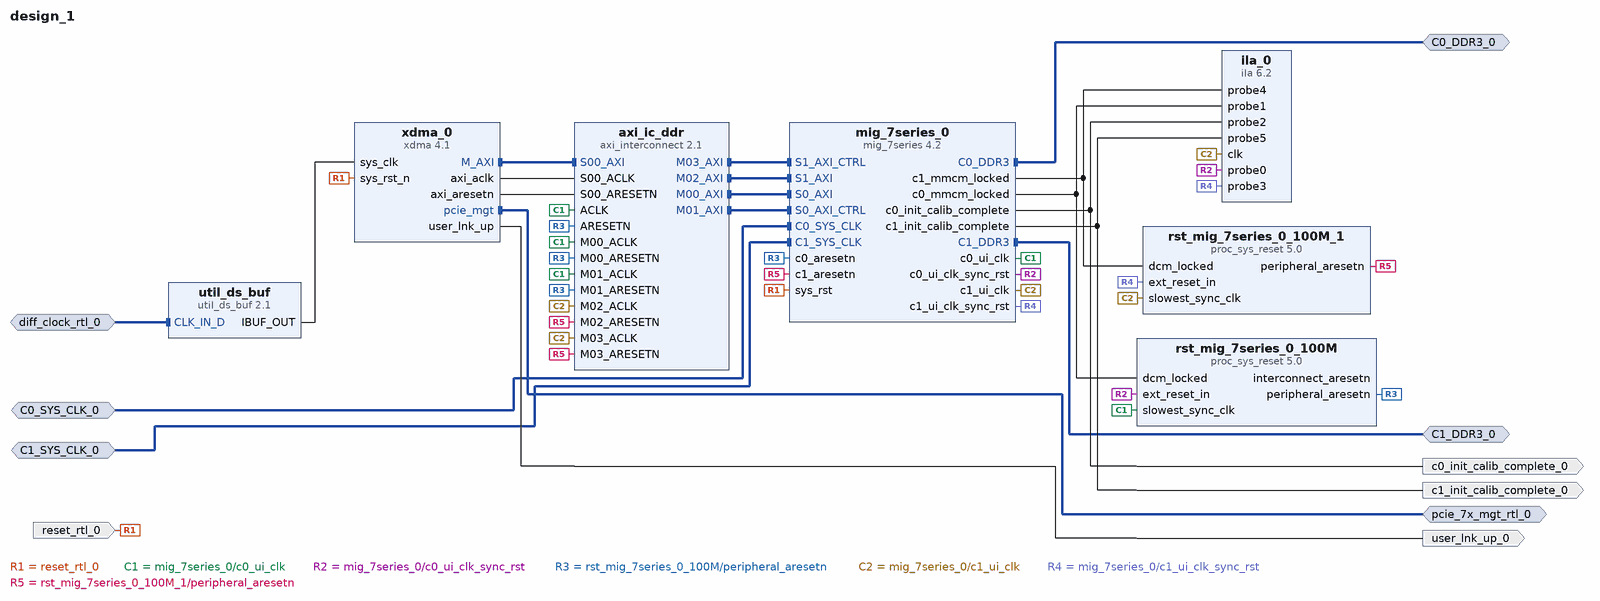
[diagram p0: block diagram of the top level]
# Vivado block design design_1, xc7k480tffg1156-2, Vivado 2020.2
create_bd_design design_1

create_bd_intf_port -mode Master -vlnv xilinx.com:interface:pcie_7x_mgt_rtl:1.0 pcie_7x_mgt_rtl_0
create_bd_intf_port -mode Slave -vlnv xilinx.com:interface:diff_clock_rtl:1.0 diff_clock_rtl_0
set_property -dict {CONFIG.FREQ_HZ 100000000} [get_bd_intf_ports diff_clock_rtl_0]
create_bd_intf_port -mode Master -vlnv xilinx.com:interface:ddrx_rtl:1.0 C0_DDR3_0
create_bd_intf_port -mode Slave -vlnv xilinx.com:interface:diff_clock_rtl:1.0 C0_SYS_CLK_0
create_bd_intf_port -mode Master -vlnv xilinx.com:interface:ddrx_rtl:1.0 C1_DDR3_0
create_bd_intf_port -mode Slave -vlnv xilinx.com:interface:diff_clock_rtl:1.0 C1_SYS_CLK_0
create_bd_port -dir I -type rst reset_rtl_0
set_property -dict {CONFIG.POLARITY ACTIVE_LOW} [get_bd_ports reset_rtl_0]
create_bd_port -dir O user_lnk_up_0
create_bd_port -dir O c0_init_calib_complete_0
create_bd_port -dir O c1_init_calib_complete_0

create_bd_cell -type ip -vlnv xilinx.com:ip:util_ds_buf:2.1 util_ds_buf
set_property -dict {CONFIG.C_BUF_TYPE IBUFDSGTE} [get_bd_cells util_ds_buf]
create_bd_cell -type ip -vlnv xilinx.com:ip:xdma:4.1 xdma_0
set_property -dict [list \
  CONFIG.PF0_DEVICE_ID_mqdma 9014 \
  CONFIG.PF2_DEVICE_ID_mqdma 9014 \
  CONFIG.PF3_DEVICE_ID_mqdma 9014 \
  CONFIG.axi_data_width 64_bit \
  CONFIG.axisten_freq 125 \
  CONFIG.mode_selection Basic \
  CONFIG.pf0_device_id 7014 \
  CONFIG.pl_link_cap_max_link_speed 2.5_GT/s \
  CONFIG.pl_link_cap_max_link_width X4 \
  CONFIG.xdma_axi_intf_mm AXI_Memory_Mapped \
  CONFIG.xdma_pcie_64bit_en false \
  CONFIG.xdma_rnum_chnl 2 \
  CONFIG.xdma_wnum_chnl 2 \
] [get_bd_cells xdma_0]
create_bd_cell -type ip -vlnv xilinx.com:ip:mig_7series:4.2 mig_7series_0
set_property -dict [list \
  CONFIG.BOARD_MIG_PARAM Custom \
  CONFIG.MIG_DONT_TOUCH_PARAM Custom \
  CONFIG.RESET_BOARD_INTERFACE Custom \
  CONFIG.XML_INPUT_FILE mig_a.prj \
] [get_bd_cells mig_7series_0]
create_bd_cell -type ip -vlnv xilinx.com:ip:axi_interconnect:2.1 axi_ic_ddr
set_property -dict {CONFIG.NUM_MI 4 CONFIG.NUM_SI 1} [get_bd_cells axi_ic_ddr]
create_bd_cell -type ip -vlnv xilinx.com:ip:proc_sys_reset:5.0 rst_mig_7series_0_100M
create_bd_cell -type ip -vlnv xilinx.com:ip:proc_sys_reset:5.0 rst_mig_7series_0_100M_1
create_bd_cell -type ip -vlnv xilinx.com:ip:ila:6.2 ila_0
set_property -dict [list \
  CONFIG.C_DATA_DEPTH 2048 \
  CONFIG.C_ENABLE_ILA_AXI_MON false \
  CONFIG.C_MONITOR_TYPE Native \
  CONFIG.C_NUM_OF_PROBES 6 \
] [get_bd_cells ila_0]

# ---- connections ----

connect_bd_intf_net -intf_net diff_clock_rtl_0_1 [get_bd_intf_ports diff_clock_rtl_0] [get_bd_intf_pins util_ds_buf/CLK_IN_D]
connect_bd_intf_net [get_bd_intf_pins axi_ic_ddr/M03_AXI] [get_bd_intf_pins mig_7series_0/S1_AXI_CTRL]
connect_bd_intf_net [get_bd_intf_pins axi_ic_ddr/M02_AXI] [get_bd_intf_pins mig_7series_0/S1_AXI]
connect_bd_intf_net [get_bd_intf_pins mig_7series_0/S0_AXI] [get_bd_intf_pins axi_ic_ddr/M00_AXI]
connect_bd_intf_net [get_bd_intf_pins xdma_0/M_AXI] [get_bd_intf_pins axi_ic_ddr/S00_AXI]
connect_bd_intf_net [get_bd_intf_ports C1_DDR3_0] [get_bd_intf_pins mig_7series_0/C1_DDR3]
connect_bd_intf_net -intf_net C0_SYS_CLK_0_1 [get_bd_intf_ports C0_SYS_CLK_0] [get_bd_intf_pins mig_7series_0/C0_SYS_CLK]
connect_bd_intf_net [get_bd_intf_ports pcie_7x_mgt_rtl_0] [get_bd_intf_pins xdma_0/pcie_mgt]
connect_bd_intf_net [get_bd_intf_pins axi_ic_ddr/M01_AXI] [get_bd_intf_pins mig_7series_0/S0_AXI_CTRL]
connect_bd_intf_net [get_bd_intf_ports C0_DDR3_0] [get_bd_intf_pins mig_7series_0/C0_DDR3]
connect_bd_intf_net -intf_net C1_SYS_CLK_0_1 [get_bd_intf_ports C1_SYS_CLK_0] [get_bd_intf_pins mig_7series_0/C1_SYS_CLK]
connect_bd_net -net reset_rtl_0_1 [get_bd_ports reset_rtl_0] [get_bd_pins xdma_0/sys_rst_n] [get_bd_pins mig_7series_0/sys_rst]
connect_bd_net [get_bd_pins util_ds_buf/IBUF_OUT] [get_bd_pins xdma_0/sys_clk]
connect_bd_net [get_bd_pins xdma_0/user_lnk_up] [get_bd_ports user_lnk_up_0]
connect_bd_net [get_bd_pins mig_7series_0/c0_ui_clk] \
  [get_bd_pins axi_ic_ddr/ACLK] [get_bd_pins rst_mig_7series_0_100M/slowest_sync_clk] [get_bd_pins axi_ic_ddr/M00_ACLK] \
  [get_bd_pins axi_ic_ddr/M01_ACLK]
connect_bd_net [get_bd_pins mig_7series_0/c0_mmcm_locked] [get_bd_pins rst_mig_7series_0_100M/dcm_locked] [get_bd_pins ila_0/probe1]
connect_bd_net [get_bd_pins mig_7series_0/c0_ui_clk_sync_rst] [get_bd_pins rst_mig_7series_0_100M/ext_reset_in] [get_bd_pins ila_0/probe0]
connect_bd_net [get_bd_pins rst_mig_7series_0_100M/peripheral_aresetn] \
  [get_bd_pins axi_ic_ddr/ARESETN] [get_bd_pins axi_ic_ddr/M00_ARESETN] [get_bd_pins mig_7series_0/c0_aresetn] \
  [get_bd_pins axi_ic_ddr/M01_ARESETN]
connect_bd_net [get_bd_pins xdma_0/axi_aclk] [get_bd_pins axi_ic_ddr/S00_ACLK]
connect_bd_net [get_bd_pins xdma_0/axi_aresetn] [get_bd_pins axi_ic_ddr/S00_ARESETN]
connect_bd_net [get_bd_pins mig_7series_0/c1_ui_clk] \
  [get_bd_pins axi_ic_ddr/M02_ACLK] [get_bd_pins rst_mig_7series_0_100M_1/slowest_sync_clk] [get_bd_pins axi_ic_ddr/M03_ACLK] \
  [get_bd_pins ila_0/clk]
connect_bd_net [get_bd_pins mig_7series_0/c1_mmcm_locked] [get_bd_pins rst_mig_7series_0_100M_1/dcm_locked] [get_bd_pins ila_0/probe4]
connect_bd_net [get_bd_pins mig_7series_0/c1_ui_clk_sync_rst] [get_bd_pins rst_mig_7series_0_100M_1/ext_reset_in] [get_bd_pins ila_0/probe3]
connect_bd_net [get_bd_pins rst_mig_7series_0_100M_1/peripheral_aresetn] \
  [get_bd_pins mig_7series_0/c1_aresetn] [get_bd_pins axi_ic_ddr/M02_ARESETN] [get_bd_pins axi_ic_ddr/M03_ARESETN]
# net rst_mig_7series_0_100M_interconnect_aresetn has one end: rst_mig_7series_0_100M/interconnect_aresetn
connect_bd_net [get_bd_pins mig_7series_0/c0_init_calib_complete] [get_bd_ports c0_init_calib_complete_0] [get_bd_pins ila_0/probe2]
connect_bd_net [get_bd_pins mig_7series_0/c1_init_calib_complete] [get_bd_ports c1_init_calib_complete_0] [get_bd_pins ila_0/probe5]

# ---- address map ----
assign_bd_address -offset 0x0000000000000000 -range 2G -target_address_space [get_bd_addr_spaces xdma_0/M_AXI] [get_bd_addr_segs mig_7series_0/c0_memmap/c0_memaddr]
assign_bd_address -offset 0x0000000080000000 -range 2G -target_address_space [get_bd_addr_spaces xdma_0/M_AXI] [get_bd_addr_segs mig_7series_0/c1_memmap/c1_memaddr]
assign_bd_address -offset 0x0000000100000000 -range 1M -target_address_space [get_bd_addr_spaces xdma_0/M_AXI] [get_bd_addr_segs mig_7series_0/c0_s_axi_ctrl_memmap/c0_s_axi_ctrl_memaddr]
assign_bd_address -offset 0x0000000100100000 -range 1M -target_address_space [get_bd_addr_spaces xdma_0/M_AXI] [get_bd_addr_segs mig_7series_0/c1_s_axi_ctrl_memmap/c1_s_axi_ctrl_memaddr]

validate_bd_design
save_bd_design
